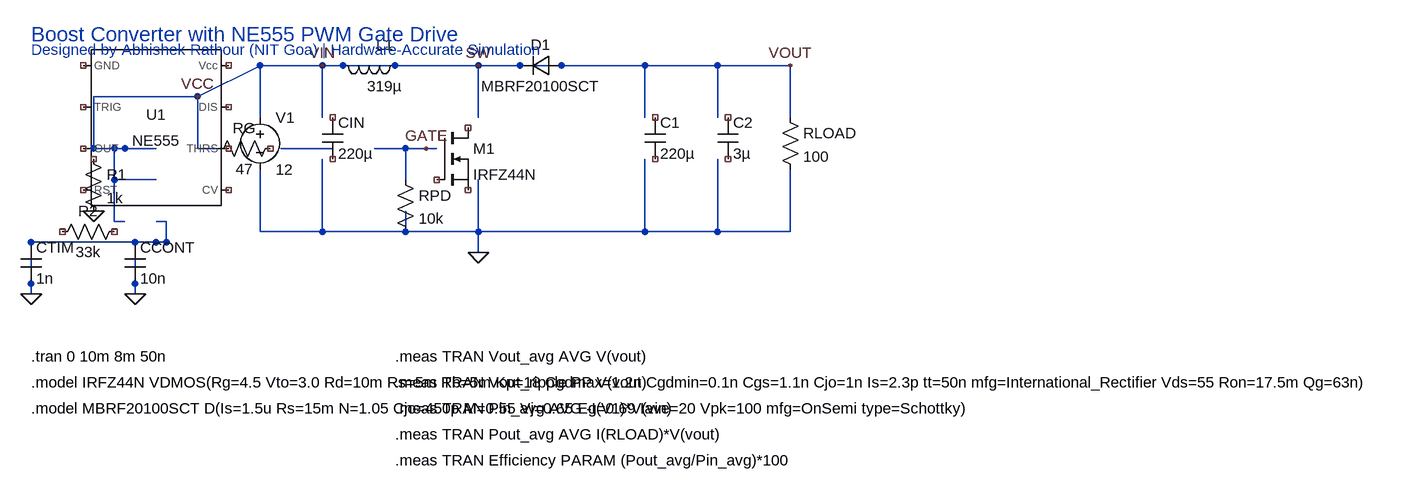
[diagram p0: schematic boost_converter_555_pwm.asc]
boost_converter_555_pwm.asc, the LTspice schematic file:
Version 4
SHEET 1 1280 880
WIRE 144 -48 48 -48
WIRE 272 -48 144 -48
WIRE 384 -48 272 -48
WIRE 512 -48 384 -48
WIRE 640 -48 512 -48
WIRE 752 -48 640 -48
WIRE 864 -48 752 -48
WIRE 48 32 48 -48
WIRE 144 32 144 -48
WIRE 384 32 384 -48
WIRE 640 32 640 -48
WIRE 752 32 752 -48
WIRE 864 32 864 -48
WIRE 48 144 48 112
WIRE 144 144 144 96
WIRE 384 144 384 128
WIRE 640 144 640 96
WIRE 752 144 752 96
WIRE 864 144 864 112
WIRE 48 208 48 144
WIRE 144 208 48 208
WIRE 144 208 144 144
WIRE 384 208 144 208
WIRE 384 208 384 144
WIRE 640 208 384 208
WIRE 640 208 640 144
WIRE 752 208 640 208
WIRE 752 208 752 144
WIRE 864 208 752 208
WIRE 864 208 864 144
WIRE 384 240 384 208
FLAG 384 240 0
FLAG 144 -48 VIN
FLAG 384 -48 SW
FLAG 864 -48 VOUT
FLAG 304 80 GATE
WIRE 320 80 304 80
WIRE 304 80 272 80
WIRE 272 80 224 80
WIRE 272 128 272 80
WIRE 272 208 272 176
WIRE 272 208 384 208
WIRE 160 80 80 80
WIRE -48 80 -16 80
WIRE -208 80 -160 80
WIRE -48 0 -48 80
WIRE -48 0 48 -48
WIRE -208 0 -208 80
WIRE -208 0 -48 0
FLAG -48 0 VCC
FLAG -208 176 0
FLAG -304 304 0
FLAG -144 304 0
SYMBOL voltage 48 16 R0
WINDOW 123 0 0 Left 2
WINDOW 39 0 0 Left 2
SYMATTR InstName V1
SYMATTR Value 12
SYMBOL cap 144 32 R0
SYMATTR InstName CIN
SYMATTR Value 220µ
SYMATTR SpiceLine Rser=0.045
SYMBOL ind 272 -64 R90
WINDOW 0 0 32 VBottom 2
WINDOW 3 32 32 VTop 2
SYMATTR InstName L1
SYMATTR Value 319µ
SYMATTR SpiceLine Rser=0.03
SYMBOL diode 512 -64 R90
WINDOW 0 0 32 VBottom 2
WINDOW 3 32 32 VTop 2
SYMATTR InstName D1
SYMATTR Value MBRF20100SCT
SYMBOL nmos 320 48 R0
SYMATTR InstName M1
SYMATTR Value IRFZ44N
SYMBOL cap 640 32 R0
SYMATTR InstName C1
SYMATTR Value 220µ
SYMATTR SpiceLine Rser=0.045
SYMBOL cap 752 32 R0
SYMATTR InstName C2
SYMATTR Value 3µ
SYMATTR SpiceLine Rser=0.005
SYMBOL res 848 16 R0
SYMATTR InstName RLOAD
SYMATTR Value 100
SYMBOL res 80 64 R90
WINDOW 0 0 56 VBottom 2
WINDOW 3 32 56 VTop 2
SYMATTR InstName RG
SYMATTR Value 47
SYMBOL res 256 112 R0
SYMATTR InstName RPD
SYMATTR Value 10k
SYMBOL Misc\\NE555 -112 48 R0
SYMATTR InstName U1
SYMBOL res -224 80 R0
SYMATTR InstName R1
SYMATTR Value 1k
SYMBOL res -160 192 R90
WINDOW 0 0 56 VBottom 2
WINDOW 3 32 56 VTop 2
SYMATTR InstName R2
SYMATTR Value 33k
SYMBOL cap -320 224 R0
SYMATTR InstName CTIM
SYMATTR Value 1n
SYMBOL cap -160 224 R0
SYMATTR InstName CCONT
SYMATTR Value 10n
WIRE -208 80 -176 80
WIRE -112 80 -176 80
WIRE -176 80 -176 128
WIRE -176 128 -112 128
WIRE -160 192 -176 192
WIRE -176 192 -176 128
WIRE -96 192 -112 192
WIRE -96 192 -96 224
WIRE -304 224 -96 224
WIRE -112 224 -96 224
WIRE -304 224 -304 288
WIRE -144 224 -112 224
WIRE -144 224 -144 288
WIRE -144 288 -144 304
WIRE -304 288 -304 304
TEXT -304 400 Left 2 !.tran 0 10m 8m 50n
TEXT -304 440 Left 2 !.model IRFZ44N VDMOS(Rg=4.5 Vto=3.0 Rd=10m Rs=5m Rb=5m Kp=18 Cgdmax=1.2n Cgdmin=0.1n Cgs=1.1n Cjo=1n Is=2.3p tt=50n mfg=International_Rectifier Vds=55 Ron=17.5m Qg=63n)
TEXT -304 480 Left 2 !.model MBRF20100SCT D(Is=1.5u Rs=15m N=1.05 Cjo=450p M=0.55 Vj=0.65 Eg=0.69 Iave=20 Vpk=100 mfg=OnSemi type=Schottky)
TEXT 256 400 Left 2 !.meas TRAN Vout_avg AVG V(vout)
TEXT 256 440 Left 2 !.meas TRAN Vout_ripple PP V(vout)
TEXT 256 480 Left 2 !.meas TRAN Pin_avg AVG -I(V1)*V(vin)
TEXT 256 520 Left 2 !.meas TRAN Pout_avg AVG I(RLOAD)*V(vout)
TEXT 256 560 Left 2 !.meas TRAN Efficiency PARAM (Pout_avg/Pin_avg)*100
TEXT -304 -96 Left 3 ;Boost Converter with NE555 PWM Gate Drive
TEXT -304 -72 Left 2 ;Designed by Abhishek Rathour (NIT Goa) | Hardware-Accurate Simulation

The netlist it stands for:
* boost_converter_555_pwm.asc
V1 VCC 0 12
CIN NC_01 NC_02 220µ Rser=0.045
L1 VCC VCC 319µ Rser=0.03
D1 VCC VCC MBRF20100SCT
* M1: IRFZ44N (symbol nmos not certain, pin order unknown); nets seen at it: 
C1 NC_06 NC_07 220µ Rser=0.045
C2 NC_08 NC_09 3µ Rser=0.005
RLOAD VCC 0 100
RG NC_10 VCC 47
RPD GATE 0 10k
* U1: NE555 (symbol Misc\NE555 not certain, pin order unknown); nets seen at it: 
R1 NC_19 0 1k
R2 NC_20 NC_21 33k
CTIM 0 0 1n
CCONT 0 0 10n
.model D D
.lib standard.dio
.tran 0 10m 8m 50n
.model IRFZ44N VDMOS(Rg=4.5 Vto=3.0 Rd=10m Rs=5m Rb=5m Kp=18 Cgdmax=1.2n Cgdmin=0.1n Cgs=1.1n Cjo=1n Is=2.3p tt=50n mfg=International_Rectifier Vds=55 Ron=17.5m Qg=63n)
.model MBRF20100SCT D(Is=1.5u Rs=15m N=1.05 Cjo=450p M=0.55 Vj=0.65 Eg=0.69 Iave=20 Vpk=100 mfg=OnSemi type=Schottky)
.meas TRAN Vout_avg AVG V(vout)
.meas TRAN Vout_ripple PP V(vout)
.meas TRAN Pin_avg AVG -I(V1)*V(vin)
.meas TRAN Pout_avg AVG I(RLOAD)*V(vout)
.meas TRAN Efficiency PARAM (Pout_avg/Pin_avg)*100
* Boost Converter with NE555 PWM Gate Drive
* Designed by Abhishek Rathour (NIT Goa) | Hardware-Accurate Simulation
.lib NE555.sub
.backanno
.end